# Altium schematic sheet Main.SchDoc: Robotic Car Motor Control
size A4; DocumentNumber: 2; Revision: 1.0; SheetNumber: 2; SheetTotal: 2
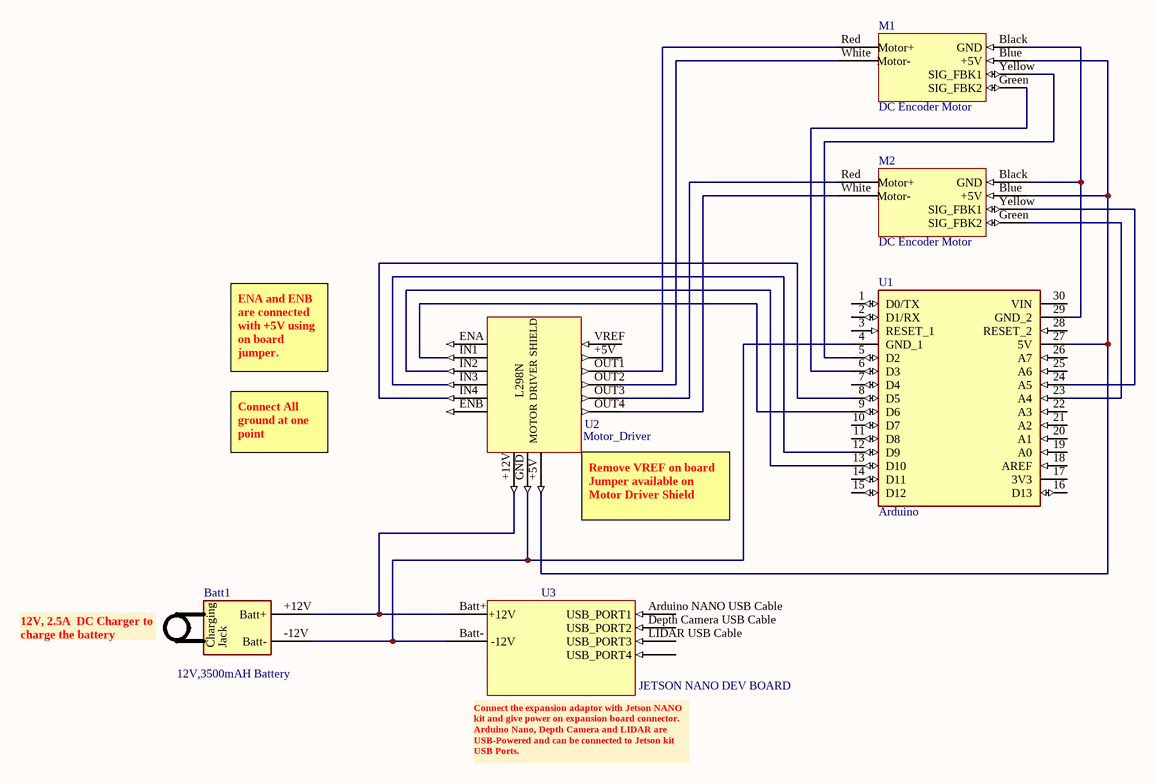
[diagram p0: Main.SchDoc]

## Parts
Batt1  12V,3500mAH Battery
M1  DC Encoder Motor
M2  DC Encoder Motor
U1  Arduino  [MODULE_A000005]
U2  Motor_Driver
U3  JETSON NANO DEV BOARD

## Nets
NetBatt1_-12V: Batt1.-12V(Batt-) U1.4(GND_1)
NetM1_Black: M1.Black(GND) M2.Black(GND) U1.29(GND_2)
NetM1_Blue: M1.Blue(+5V) M2.Blue(+5V) U1.27(5V)
NetM1_Green: M1.Green(SIG_FBK2) U1.6(D3)
NetM1_Yellow: M1.Yellow(SIG_FBK1) U1.5(D2)
NetM2_Green: M2.Green(SIG_FBK2) U1.23(A4)
NetM2_Yellow: M2.Yellow(SIG_FBK1) U1.24(A5)

Not connected (* = marked no-connect by the designer): Batt1 +12V(Batt+); M1 Red(Motor+) White(Motor-); M2 Red(Motor+) White(Motor-); U1 1(D0/TX) 2(D1/RX) 3(RESET_1) 7(D4) 8(D5) 9(D6) 10(D7) 11(D8) 12(D9) 13(D10) 14(D11) 15(D12) 16(D13) 17(3V3) 18(AREF) 19(A0) 20(A1) 21(A2) 22(A3) 25(A6) 26(A7) 28(RESET_2) 30(VIN); U2 +5V +12V ENA ENB GND IN1 IN2 IN3 IN4 OUT1 OUT2 OUT3 OUT4 VREF; U3 ?1(USB_PORT4) Arduino NANO USB Cable(USB_PORT1) Batt+(+12V) Batt-(-12V) Depth Camera USB Cable(USB_PORT2) LIDAR USB Cable(USB_PORT3)

## Notes on the sheet
- ENA and ENB are connected with +5V using on board jumper.
- Connect All ground at one point
- (near U2) Remove VREF on board Jumper available on Motor Driver Shield
- Designed by:
- Title
- Size:
- Date:
- A4
- Number:
- Time:
- Revision:
- Sheet
- of
- M. Huzaifa
- Rahim Malik
- File:
- (in symbol 12V,3500mAH Battery) 12V, 2.5A  DC Charger to charge the battery; Charging; Jack
- (in symbol JETSON NANO DEV BOARD) Connect the expansion adaptor with Jetson NANO kit and give power on expansion board connector. / Arduino Nano, Depth Camera and LIDAR are USB-Powered and can be connected to Jetson kit USB Ports.
- (in symbol Motor_Driver) L298N; MOTOR DRIVER SHIELD

## Library data of the parts
U1 = Arduino: Small, complete, and breadboard-friendly board based on the ATmega328 (Arduino Nano 3.x).; MP: A000005; Check_prices: https://www.snapeda.com/parts/A000005/Arduino/view-part/?ref=eda; Value: *; Availability: In Stock; Price: None; Package: Non-Standard Arduino; SnapEDA_Link: https://www.snapeda.com/parts/A000005/Arduino/view-part/?ref=snap; Purchase-URL: https://pricing.snapeda.com/search/part/A000005/?ref=eda; MF: Arduino